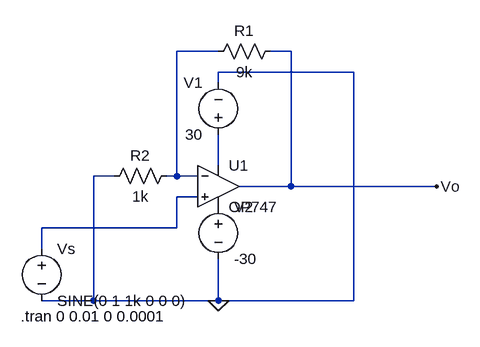
[diagram p0: schematic stage2_gain_x10.asc]
stage2_gain_x10.asc, the LTspice schematic file:
Version 4.1
SHEET 1 880 680
WIRE 144 -64 80 -64
WIRE 256 -64 224 -64
WIRE 352 -32 144 -32
WIRE 144 -16 144 -32
WIRE 144 112 144 64
WIRE -16 128 -48 128
WIRE 80 128 80 -64
WIRE 80 128 64 128
WIRE 112 128 80 128
WIRE 256 144 256 -64
WIRE 256 144 176 144
WIRE 480 144 256 144
WIRE 112 160 80 160
WIRE 80 208 80 160
WIRE 80 208 -128 208
WIRE -128 240 -128 208
WIRE -48 320 -48 128
WIRE -48 320 -128 320
WIRE 144 320 144 256
WIRE 144 320 -48 320
WIRE 352 320 352 -32
WIRE 352 320 144 320
FLAG 144 320 0
FLAG 480 144 Vo
SYMBOL OpAmps\\OP747 144 80 R0
SYMATTR InstName U1
SYMBOL res 80 112 R90
WINDOW 0 0 56 VBottom 2
WINDOW 3 32 56 VTop 2
SYMATTR InstName R2
SYMATTR Value 1k
SYMBOL res 240 -80 R90
WINDOW 0 0 56 VBottom 2
WINDOW 3 32 56 VTop 2
SYMATTR InstName R1
SYMATTR Value 9k
SYMBOL voltage 144 80 R180
WINDOW 0 24 96 Left 2
WINDOW 3 24 16 Left 2
SYMATTR InstName V1
SYMATTR Value 30
SYMBOL voltage 144 160 R0
WINDOW 123 0 0 Left 0
WINDOW 39 0 0 Left 0
SYMATTR InstName V2
SYMATTR Value -30
SYMBOL voltage -128 224 R0
WINDOW 123 0 0 Left 0
WINDOW 39 0 0 Left 0
SYMATTR InstName Vs
SYMATTR Value SINE(0 1 1k 0 0 0)
TEXT -160 344 Left 2 !.tran 0 0.01 0 0.0001

The netlist it stands for:
* stage2_gain_x10.asc
X§U1 N003 N001 N002 P001 Vo OP747  ; pins In+ In- V+ V- OUT
R2 N001 0 1k
R1 Vo N001 9k
V1 N002 0 30
V2 P001 0 -30
Vs N003 0 SINE(0 1 1k 0 0 0)
.tran 0 0.01 0 0.0001
.backanno
.end